# Altium schematic sheet 24_Radar_bypass.SchDoc
size 289 x 396 mm
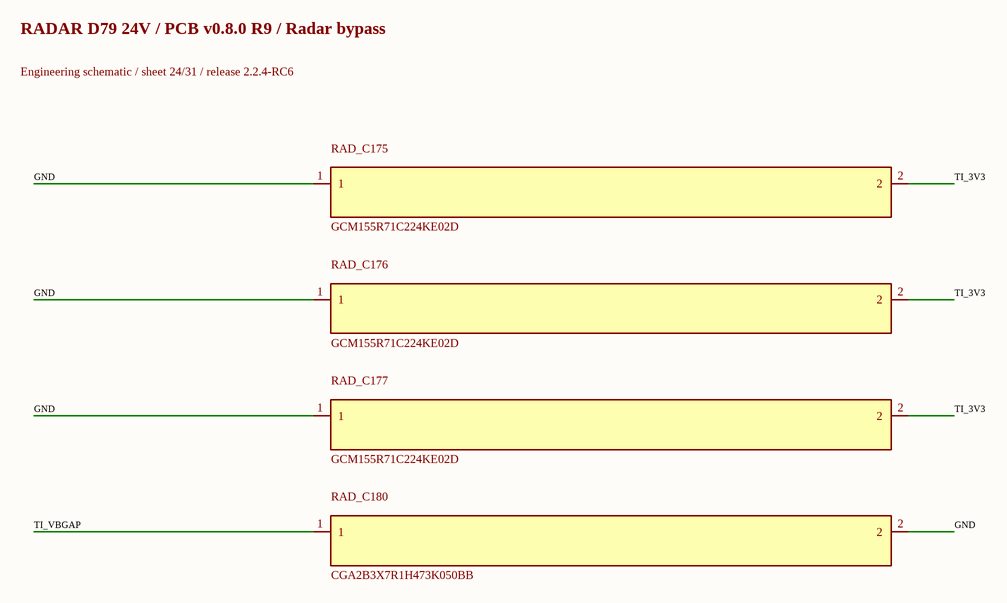
[diagram p0: 24_Radar_bypass.SchDoc]

## Parts
RAD_C175  GCM155R71C224KE02D  [0402L]
RAD_C176  GCM155R71C224KE02D  [0402L]
RAD_C177  GCM155R71C224KE02D  [0402L]
RAD_C180  CGA2B3X7R1H473K050BB  [0402L]

## Nets
GND: RAD_C175.1 RAD_C176.1 RAD_C177.1 RAD_C180.2
TI_3V3: RAD_C175.2 RAD_C176.2 RAD_C177.2
TI_VBGAP: RAD_C180.1

## Notes on the sheet
- RADAR D79 24V / PCB v0.8.0 R9 / Radar bypass
- Engineering schematic / sheet 24/31 / release 2.2.4-RC6